# Altium schematic sheet Controller_Section.SchDoc
size A4; DocumentNumber: 6; SheetNumber: 6; SheetTotal: 27
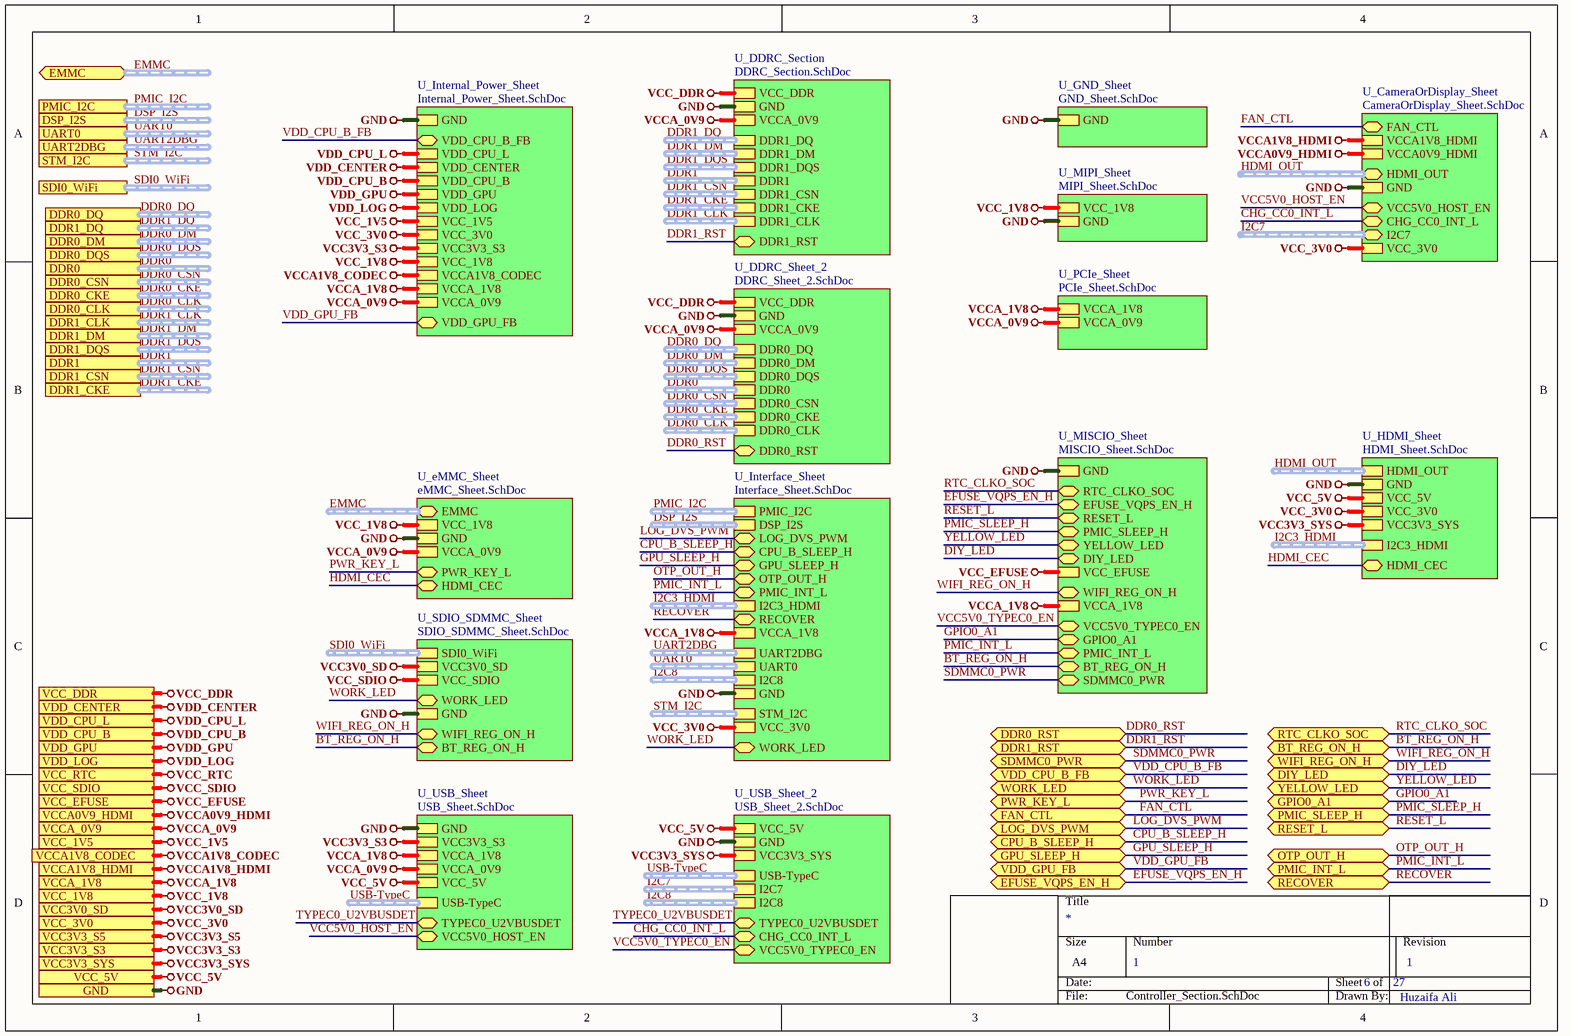
[diagram p0: Controller_Section.SchDoc]

## Sub-sheets
U_CameraOrDisplay_Sheet = CameraOrDisplay_Sheet.SchDoc: FAN_CTL (bidir), VCCA1V8_HDMI, VCCA0V9_HDMI, HDMI_OUT (bidir, harness HDMI_OUT), GND, VCC5V0_HOST_EN (bidir), CHG_CC0_INT_L (bidir), I2C7 (bidir, harness I2C7), VCC_3V0
U_DDRC_Section = DDRC_Section.SchDoc: VCC_DDR, GND, VCCA_0V9, DDR1_DQ (harness DDR1_DQ), DDR1_DM (harness DDR1_DM), DDR1_DQS (harness DDR1_DQS), DDR1 (harness DDR1), DDR1_CSN (harness DDR1_CSN), DDR1_CKE (harness DDR1_CKE), DDR1_CLK (harness DDR1_CLK), DDR1_RST (bidir)
U_DDRC_Sheet_2 = DDRC_Sheet_2.SchDoc: VCC_DDR, GND, VCCA_0V9, DDR0_DQ (harness DDR0_DQ), DDR0_DM (harness DDR0_DM), DDR0_DQS (harness DDR0_DQS), DDR0 (harness DDR0), DDR0_CSN (harness DDR0_CSN), DDR0_CKE (harness DDR0_CKE), DDR0_CLK (harness DDR0_CLK), DDR0_RST (bidir)
U_eMMC_Sheet = eMMC_Sheet.SchDoc: EMMC (bidir, harness EMMC), VCC_1V8, GND, VCCA_0V9, PWR_KEY_L (bidir), HDMI_CEC (bidir)
U_GND_Sheet = GND_Sheet.SchDoc: GND
U_HDMI_Sheet = HDMI_Sheet.SchDoc: HDMI_OUT (harness HDMI_OUT), GND, VCC_5V, VCC_3V0, VCC3V3_SYS, I2C3_HDMI (harness I2C3_HDMI), HDMI_CEC (bidir)
U_Interface_Sheet = Interface_Sheet.SchDoc: PMIC_I2C (harness PMIC_I2C), DSP_I2S (harness DSP_I2S), LOG_DVS_PWM (bidir), CPU_B_SLEEP_H (bidir), GPU_SLEEP_H (bidir), OTP_OUT_H (bidir), PMIC_INT_L (bidir), I2C3_HDMI (harness I2C3_HDMI), RECOVER (bidir), VCCA_1V8, UART2DBG (harness UART2DBG), UART0 (harness UART0), I2C8 (harness I2C8), GND, STM_I2C (harness STM_I2C), VCC_3V0, WORK_LED (bidir)
U_Internal_Power_Sheet = Internal_Power_Sheet.SchDoc: GND, VDD_CPU_B_FB (bidir), VDD_CPU_L, VDD_CENTER, VDD_CPU_B, VDD_GPU, VDD_LOG, VCC_1V5, VCC_3V0, VCC3V3_S3, VCC_1V8, VCCA1V8_CODEC, VCCA_1V8, VCCA_0V9, VDD_GPU_FB (bidir)
U_MIPI_Sheet = MIPI_Sheet.SchDoc: VCC_1V8, GND
U_MISCIO_Sheet = MISCIO_Sheet.SchDoc: GND, RTC_CLKO_SOC (bidir), EFUSE_VQPS_EN_H (bidir), RESET_L (bidir), PMIC_SLEEP_H (bidir), YELLOW_LED (bidir), DIY_LED (bidir), VCC_EFUSE, WIFI_REG_ON_H (bidir), VCCA_1V8, VCC5V0_TYPEC0_EN (bidir), GPIO0_A1 (bidir), PMIC_INT_L (bidir), BT_REG_ON_H (bidir), SDMMC0_PWR (bidir)
U_PCIe_Sheet = PCIe_Sheet.SchDoc: VCCA_1V8, VCCA_0V9
U_SDIO_SDMMC_Sheet = SDIO_SDMMC_Sheet.SchDoc: SDI0_WiFi (harness SDI0_WiFi), VCC3V0_SD, VCC_SDIO, WORK_LED (bidir), GND, WIFI_REG_ON_H (bidir), BT_REG_ON_H (bidir)
U_USB_Sheet = USB_Sheet.SchDoc: GND, VCC3V3_S3, VCCA_1V8, VCCA_0V9, VCC_5V, USB-TypeC (harness USB-TypeC), TYPEC0_U2VBUSDET (bidir), VCC5V0_HOST_EN (bidir)
U_USB_Sheet_2 = USB_Sheet_2.SchDoc: VCC_5V, GND, VCC3V3_SYS, USB-TypeC (harness USB-TypeC), I2C7 (harness I2C7), I2C8 (harness I2C8), TYPEC0_U2VBUSDET (bidir), CHG_CC0_INT_L (bidir), VCC5V0_TYPEC0_EN (bidir)

## Ports
BT_REG_ON_H (bidir), CPU_B_SLEEP_H (bidir), DDR0, DDR0_CKE, DDR0_CLK, DDR0_CSN, DDR0_DM, DDR0_DQ, DDR0_DQS, DDR0_RST (bidir), DDR1, DDR1_CKE, DDR1_CLK, DDR1_CSN, DDR1_DM, DDR1_DQ, DDR1_DQS, DDR1_RST (bidir), DIY_LED (bidir), DSP_I2S (harness DSP_I2S), EFUSE_VQPS_EN_H (bidir), EMMC (bidir, harness EMMC), FAN_CTL (bidir), GND, GPIO0_A1 (bidir), GPU_SLEEP_H (bidir), LOG_DVS_PWM (bidir), OTP_OUT_H (bidir), PMIC_I2C (harness PMIC_I2C), PMIC_INT_L (bidir), PMIC_SLEEP_H (bidir), PWR_KEY_L (bidir), RECOVER (bidir), RESET_L (bidir), RTC_CLKO_SOC (bidir), SDI0_WiFi (harness SDI0_WiFi), SDMMC0_PWR (bidir), STM_I2C (harness STM_I2C), UART0 (harness UART0), UART2DBG (harness UART2DBG), VCC3V0_SD, VCC3V3_S3, VCC3V3_S5, VCC3V3_SYS, VCC_1V5, VCC_1V8, VCC_3V0, VCC_5V, VCC_DDR, VCC_EFUSE, VCC_RTC, VCC_SDIO, VCCA0V9_HDMI, VCCA1V8_CODEC, VCCA1V8_HDMI, VCCA_0V9, VCCA_1V8, VDD_CENTER, VDD_CPU_B, VDD_CPU_B_FB (bidir), VDD_CPU_L, VDD_GPU, VDD_GPU_FB (bidir), VDD_LOG, WIFI_REG_ON_H (bidir), WORK_LED (bidir), YELLOW_LED (bidir)

## Nets
GND: port GND, sheet U_Internal_Power_Sheet/GND, sheet U_GND_Sheet/GND, sheet U_CameraOrDisplay_Sheet/GND, sheet U_eMMC_Sheet/GND, sheet U_MIPI_Sheet/GND, sheet U_HDMI_Sheet/GND, sheet U_USB_Sheet_2/GND, sheet U_USB_Sheet/GND, sheet U_MISCIO_Sheet/GND, sheet U_Interface_Sheet/GND, sheet U_SDIO_SDMMC_Sheet/GND, sheet U_DDRC_Section/GND, sheet U_DDRC_Sheet_2/GND
VCC3V0_SD: port VCC3V0_SD, sheet U_SDIO_SDMMC_Sheet/VCC3V0_SD
VCC3V3_S3: port VCC3V3_S3, sheet U_Internal_Power_Sheet/VCC3V3_S3, sheet U_USB_Sheet/VCC3V3_S3
VCC3V3_S5: port VCC3V3_S5
VCC3V3_SYS: port VCC3V3_SYS, sheet U_HDMI_Sheet/VCC3V3_SYS, sheet U_USB_Sheet_2/VCC3V3_SYS
VCC_1V5: port VCC_1V5, sheet U_Internal_Power_Sheet/VCC_1V5
VCC_1V8: port VCC_1V8, sheet U_Internal_Power_Sheet/VCC_1V8, sheet U_eMMC_Sheet/VCC_1V8, sheet U_MIPI_Sheet/VCC_1V8
VCC_3V0: port VCC_3V0, sheet U_Internal_Power_Sheet/VCC_3V0, sheet U_CameraOrDisplay_Sheet/VCC_3V0, sheet U_HDMI_Sheet/VCC_3V0, sheet U_Interface_Sheet/VCC_3V0
VCC_5V: port VCC_5V, sheet U_HDMI_Sheet/VCC_5V, sheet U_USB_Sheet_2/VCC_5V, sheet U_USB_Sheet/VCC_5V
VCC_DDR: port VCC_DDR, sheet U_DDRC_Section/VCC_DDR, sheet U_DDRC_Sheet_2/VCC_DDR
VCC_EFUSE: port VCC_EFUSE, sheet U_MISCIO_Sheet/VCC_EFUSE
VCC_RTC: port VCC_RTC
VCC_SDIO: port VCC_SDIO, sheet U_SDIO_SDMMC_Sheet/VCC_SDIO
VCCA0V9_HDMI: port VCCA0V9_HDMI, sheet U_CameraOrDisplay_Sheet/VCCA0V9_HDMI
VCCA1V8_CODEC: port VCCA1V8_CODEC, sheet U_Internal_Power_Sheet/VCCA1V8_CODEC
VCCA1V8_HDMI: port VCCA1V8_HDMI, sheet U_CameraOrDisplay_Sheet/VCCA1V8_HDMI
VCCA_0V9: port VCCA_0V9, sheet U_Internal_Power_Sheet/VCCA_0V9, sheet U_eMMC_Sheet/VCCA_0V9, sheet U_PCIe_Sheet/VCCA_0V9, sheet U_USB_Sheet/VCCA_0V9, sheet U_DDRC_Section/VCCA_0V9, sheet U_DDRC_Sheet_2/VCCA_0V9
VCCA_1V8: port VCCA_1V8, sheet U_Internal_Power_Sheet/VCCA_1V8, sheet U_PCIe_Sheet/VCCA_1V8, sheet U_USB_Sheet/VCCA_1V8, sheet U_MISCIO_Sheet/VCCA_1V8, sheet U_Interface_Sheet/VCCA_1V8
VDD_CENTER: port VDD_CENTER, sheet U_Internal_Power_Sheet/VDD_CENTER
VDD_CPU_B: port VDD_CPU_B, sheet U_Internal_Power_Sheet/VDD_CPU_B
VDD_CPU_L: port VDD_CPU_L, sheet U_Internal_Power_Sheet/VDD_CPU_L
VDD_GPU: port VDD_GPU, sheet U_Internal_Power_Sheet/VDD_GPU
VDD_LOG: port VDD_LOG, sheet U_Internal_Power_Sheet/VDD_LOG
BT_REG_ON_H: port BT_REG_ON_H, sheet U_MISCIO_Sheet/BT_REG_ON_H, sheet U_SDIO_SDMMC_Sheet/BT_REG_ON_H
CHG_CC0_INT_L: sheet U_CameraOrDisplay_Sheet/CHG_CC0_INT_L, sheet U_USB_Sheet_2/CHG_CC0_INT_L
CPU_B_SLEEP_H: port CPU_B_SLEEP_H, sheet U_Interface_Sheet/CPU_B_SLEEP_H
DDR0_RST: port DDR0_RST, sheet U_DDRC_Sheet_2/DDR0_RST
DDR1_RST: port DDR1_RST, sheet U_DDRC_Section/DDR1_RST
DIY_LED: port DIY_LED, sheet U_MISCIO_Sheet/DIY_LED
EFUSE_VQPS_EN_H: port EFUSE_VQPS_EN_H, sheet U_MISCIO_Sheet/EFUSE_VQPS_EN_H
FAN_CTL: port FAN_CTL, sheet U_CameraOrDisplay_Sheet/FAN_CTL
GPIO0_A1: port GPIO0_A1, sheet U_MISCIO_Sheet/GPIO0_A1
GPU_SLEEP_H: port GPU_SLEEP_H, sheet U_Interface_Sheet/GPU_SLEEP_H
HDMI_CEC: sheet U_eMMC_Sheet/HDMI_CEC, sheet U_HDMI_Sheet/HDMI_CEC
LOG_DVS_PWM: port LOG_DVS_PWM, sheet U_Interface_Sheet/LOG_DVS_PWM
OTP_OUT_H: port OTP_OUT_H, sheet U_Interface_Sheet/OTP_OUT_H
PMIC_INT_L: port PMIC_INT_L, sheet U_MISCIO_Sheet/PMIC_INT_L, sheet U_Interface_Sheet/PMIC_INT_L
PMIC_SLEEP_H: port PMIC_SLEEP_H, sheet U_MISCIO_Sheet/PMIC_SLEEP_H
PWR_KEY_L: port PWR_KEY_L, sheet U_eMMC_Sheet/PWR_KEY_L
RECOVER: port RECOVER, sheet U_Interface_Sheet/RECOVER
RESET_L: port RESET_L, sheet U_MISCIO_Sheet/RESET_L
RTC_CLKO_SOC: port RTC_CLKO_SOC, sheet U_MISCIO_Sheet/RTC_CLKO_SOC
SDMMC0_PWR: port SDMMC0_PWR, sheet U_MISCIO_Sheet/SDMMC0_PWR
TYPEC0_U2VBUSDET: sheet U_USB_Sheet_2/TYPEC0_U2VBUSDET, sheet U_USB_Sheet/TYPEC0_U2VBUSDET
VCC5V0_HOST_EN: sheet U_CameraOrDisplay_Sheet/VCC5V0_HOST_EN, sheet U_USB_Sheet/VCC5V0_HOST_EN
VCC5V0_TYPEC0_EN: sheet U_USB_Sheet_2/VCC5V0_TYPEC0_EN, sheet U_MISCIO_Sheet/VCC5V0_TYPEC0_EN
VDD_CPU_B_FB: port VDD_CPU_B_FB, sheet U_Internal_Power_Sheet/VDD_CPU_B_FB
VDD_GPU_FB: port VDD_GPU_FB, sheet U_Internal_Power_Sheet/VDD_GPU_FB
WIFI_REG_ON_H: port WIFI_REG_ON_H, sheet U_MISCIO_Sheet/WIFI_REG_ON_H, sheet U_SDIO_SDMMC_Sheet/WIFI_REG_ON_H
WORK_LED: port WORK_LED, sheet U_Interface_Sheet/WORK_LED, sheet U_SDIO_SDMMC_Sheet/WORK_LED
YELLOW_LED: port YELLOW_LED, sheet U_MISCIO_Sheet/YELLOW_LED

## Buses and harness runs
harness DDR0 = port DDR0
harness DDR0 = sheet U_DDRC_Sheet_2/DDR0
harness DDR0_CKE = port DDR0_CKE
harness DDR0_CKE = sheet U_DDRC_Sheet_2/DDR0_CKE
harness DDR0_CLK = port DDR0_CLK
harness DDR0_CLK = sheet U_DDRC_Sheet_2/DDR0_CLK
harness DDR0_CSN = port DDR0_CSN
harness DDR0_CSN = sheet U_DDRC_Sheet_2/DDR0_CSN
harness DDR0_DM = port DDR0_DM
harness DDR0_DM = sheet U_DDRC_Sheet_2/DDR0_DM
harness DDR0_DQ = port DDR0_DQ
harness DDR0_DQ = sheet U_DDRC_Sheet_2/DDR0_DQ
harness DDR0_DQS = port DDR0_DQS
harness DDR0_DQS = sheet U_DDRC_Sheet_2/DDR0_DQS
harness DDR1 = port DDR1
harness DDR1 = sheet U_DDRC_Section/DDR1
harness DDR1_CKE = port DDR1_CKE
harness DDR1_CKE = sheet U_DDRC_Section/DDR1_CKE
harness DDR1_CLK = port DDR1_CLK
harness DDR1_CLK = sheet U_DDRC_Section/DDR1_CLK
harness DDR1_CSN = port DDR1_CSN
harness DDR1_CSN = sheet U_DDRC_Section/DDR1_CSN
harness DDR1_DM = port DDR1_DM
harness DDR1_DM = sheet U_DDRC_Section/DDR1_DM
harness DDR1_DQ = port DDR1_DQ
harness DDR1_DQ = sheet U_DDRC_Section/DDR1_DQ
harness DDR1_DQS = port DDR1_DQS
harness DDR1_DQS = sheet U_DDRC_Section/DDR1_DQS
harness DSP_I2S = port DSP_I2S
harness DSP_I2S = sheet U_Interface_Sheet/DSP_I2S
harness EMMC = port EMMC
harness EMMC = sheet U_eMMC_Sheet/EMMC
harness HDMI_OUT = sheet U_CameraOrDisplay_Sheet/HDMI_OUT
harness HDMI_OUT = sheet U_HDMI_Sheet/HDMI_OUT
harness I2C3_HDMI = sheet U_HDMI_Sheet/I2C3_HDMI
harness I2C3_HDMI = sheet U_Interface_Sheet/I2C3_HDMI
harness I2C7 = sheet U_CameraOrDisplay_Sheet/I2C7
harness I2C7 = sheet U_USB_Sheet_2/I2C7
harness I2C8 = sheet U_Interface_Sheet/I2C8
harness I2C8 = sheet U_USB_Sheet_2/I2C8
harness PMIC_I2C = port PMIC_I2C
harness PMIC_I2C = sheet U_Interface_Sheet/PMIC_I2C
harness SDI0_WiFi = port SDI0_WiFi
harness SDI0_WiFi = sheet U_SDIO_SDMMC_Sheet/SDI0_WiFi
harness STM_I2C = port STM_I2C
harness STM_I2C = sheet U_Interface_Sheet/STM_I2C
harness UART0 = port UART0
harness UART0 = sheet U_Interface_Sheet/UART0
harness UART2DBG = port UART2DBG
harness UART2DBG = sheet U_Interface_Sheet/UART2DBG
harness USB-TypeC = sheet U_USB_Sheet/USB-TypeC
harness USB-TypeC = sheet U_USB_Sheet_2/USB-TypeC

## Notes on the sheet
- 1
- Huzaifa Ali